# Altium schematic sheet [04] - uCONTROLLER AND GSM DIAGRAM.SchDoc
size A3; DocumentNumber: 2; SheetNumber: 2; SheetTotal: 4; .Checked PCB: .; .Checked SCH: .
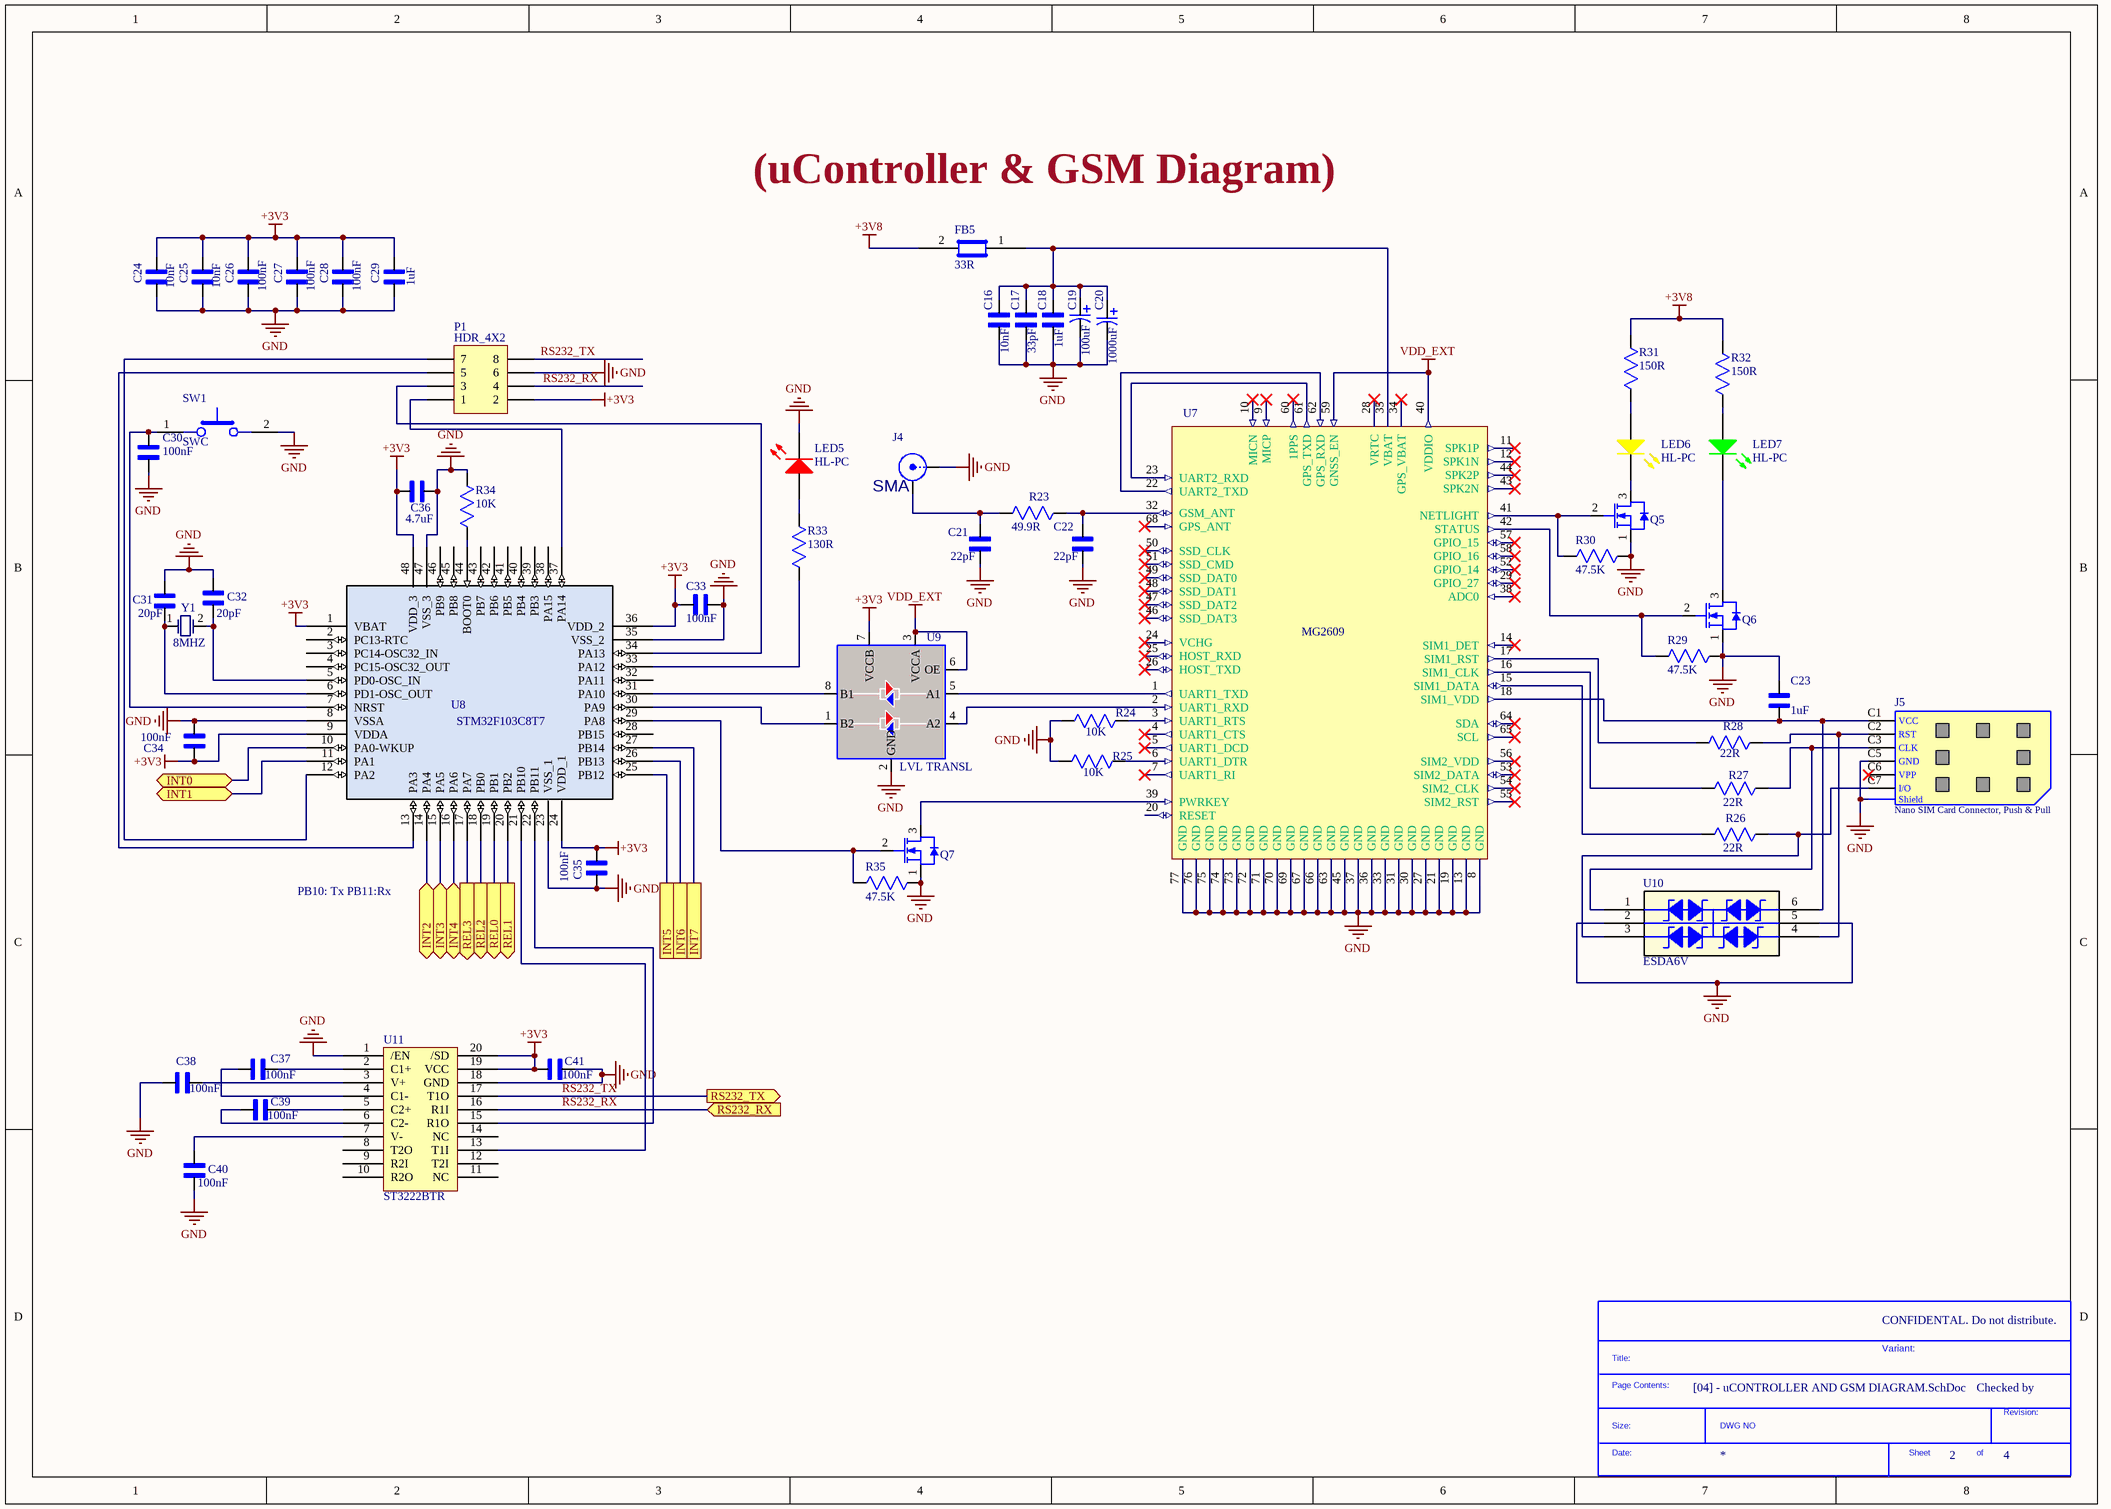
[diagram p0: [04] - uCONTROLLER AND GSM DIAGRAM.SchDoc]

## Parts
*  SDTitleBlock  (value not drawn)  (graphical)
C16  10nF  [CAP_0805]
C17  33pF  [CAP_0805]
C18  1uF  [CAP_0805]
C19  100uF  [CAP_TANT_CASEB]
C20  1000uF  [CAP_AL_0810]
C21  22pF  [CAP_0805]
C22  22pF  [CAP_0805]
C23  1uF  [CAP_0805]
C24  10nF  [CAP_0805]
C25  10nF  [CAP_0805]
C26  100nF  [CAP_0805]
C27  100nF  [CAP_0805]
C28  100nF  [CAP_0805]
C29  1uF  [CAP_0805]
C30  100nF  [CAP_0805]
C31  20pF  [CAP_0805]
C32  20pF  [CAP_0805]
C33  100nF  [CAP_0805]
C34  100nF  [CAP_0805]
C35  100nF  [CAP_0805]
C36  4.7uF  [CAP_0805]
C37  100nF  [CAP_0805]
C38  100nF  [CAP_0805]
C39  100nF  [CAP_0805]
C40  100nF  [CAP_0805]
C41  100nF  [CAP_0805]
FB5  33R  [FB_0603]
J4  SMA  [CONN_SMA_H]
J5  Nano SIM Card Connector, Push & Pull  [SOC_NSIM]
LED5  HL-PC  [LED_RED_1206]
LED6  HL-PC  [LED_YELLOW_1206]
LED7  HL-PC  [LED_GREEN_1206]
P1  HDR_4X2  [HDR2X4]
Q5  UTM2054G  [SOT-23]  (value not drawn)
Q6  UTM2054G  [SOT-23]  (value not drawn)
Q7  UTM2054G  [SOT-23]  (value not drawn)
R23  49.9R  [RES_0603]
R24  10K  [RES_0805]
R25  10K  [RES_0805]
R26  22R  [RES_0805]
R27  22R  [RES_0805]
R28  22R  [RES_0805]
R29  47.5K  [RES_0805]
R30  47.5K  [RES_0805]
R31  150R  [RES_0805]
R32  150R  [RES_0805]
R33  130R  [RES_0805]
R34  10K  [RES_0805]
R35  47.5K  [RES_0805]
SW1  SWC  [TAC_0603_VT]
U7  MG2609  [LCC_17P6X15P7X2P3]
U8  STM32F103C8T7  [LQFP-48]
U9  LVL TRANSL  [VSSOP8]
U10  ESDA6V  [SOT23-6L]
U11  ST3222BTR  [TSSOP20]
Y1  8MHZ  [CRYS_THT]

## Ports
INT0 (bidir), INT1 (bidir), INT2 (bidir), INT3 (bidir), INT4 (bidir), INT5, INT6, INT7, REL0 (out), REL1 (out), REL2 (out), REL3 (out), RS232_RX (in), RS232_TX (out)

## Nets
+3V3: C24.2 C25.2 C26.2 C27.2 C28.2 C29.2 C33.1 C34.2 C35.1 C36.1 C41.1 P1.2 U8.1(VBAT) U8.9(VDDA) U8.24(VDD_1) U8.36(VDD_2) U8.48(VDD_3) U9.7(VCCB) U11.19(VCC) U11.20(/SD)
+3V8: FB5.2 R31.1 R32.1
GND: C16.1 C17.1 C18.1 C19.2 C20.2 C21.1 C22.1 C23.2 C24.1 C25.1 C26.1 C27.1 C28.1 C29.1 C30.2 C31.2 C32.2 C33.2 C34.1 C35.2 C36.2 C38.1 C40.1 C41.2 J4.2 J5.C5(GND) J5.Shield LED5.1(K) P1.6 Q5.1(S) Q6.1(S) Q7.1(S) R24.2 R25.2 R29.1 R30.1 R34.1 R35.1 SW1.2 U7.8(GND) U7.13(GND) U7.19(GND) U7.21(GND) U7.27(GND) U7.30(GND) U7.31(GND) U7.33(GND) U7.36(GND) U7.37(GND) U7.45(GND) U7.63(GND) U7.66(GND) U7.67(GND) U7.69(GND) U7.70(GND) U7.71(GND) U7.72(GND) U7.73(GND) U7.74(GND) U7.75(GND) U7.76(GND) U7.77(GND) U8.8(VSSA) U8.23(VSS_1) U8.35(VSS_2) U8.47(VSS_3) U9.2(GND) U10.2 U10.5 U11.1(/EN) U11.18(GND)
VDD_EXT: U7.40(VDDIO) U7.59(GNSS_EN) U9.3(VCCA) U9.6(OE)
INT0: U8.10(PA0-WKUP) ; port INT0
INT1: U8.11(PA1) ; port INT1
INT2: U8.14(PA4) ; port INT2
INT3: U8.15(PA5) ; port INT3
INT4: U8.16(PA6) ; port INT4
INT5: U8.25(PB12) ; port INT5
INT6: U8.26(PB13) ; port INT6
INT7: U8.27(PB14) ; port INT7
REL0: U8.19(PB1) ; port REL0
REL1: U8.20(PB2) ; port REL1
REL2: U8.18(PB0) ; port REL2
REL3: U8.17(PA7) ; port REL3
RS232_RX: P1.4 U11.16(R1I) ; port RS232_RX
RS232_TX: P1.8 U11.17(T1O) ; port RS232_TX
NetC16_2: C16.2 C17.2 C18.2 C19.1 C20.1 FB5.1 U7.35(VBAT)
NetC21_2: C21.2 J4.1 R23.2
NetC22_2: C22.2 R23.1 U7.32(GSM_ANT)
NetC23_1: C23.1 J5.C1(VCC) U7.18(SIM1_VDD) U10.6
NetC30_1: C30.1 SW1.1 U8.7(NRST)
NetC31_1: C31.1 U8.6(PD1-OSC_OUT) Y1.1
NetC32_1: C32.1 U8.5(PD0-OSC_IN) Y1.2
NetC37_1: C37.1 U11.4(C1-)
NetC37_2: C37.2 U11.2(C1+)
NetC38_2: C38.2 U11.3(V+)
NetC39_1: C39.1 U11.6(C2-)
NetC39_2: C39.2 U11.5(C2+)
NetC40_2: C40.2 U11.7(V-)
NetJ5_C2: J5.C2(RST) R28.1 U10.4
NetJ5_C3: J5.C3(CLK) R27.1 U10.1
NetJ5_C7: J5.C7(I/O) R26.1 U10.3
NetLED5_2: LED5.2(A) R33.1
NetLED6_1: LED6.1(K) Q5.3(D)
NetLED6_2: LED6.2(A) R31.2
NetLED7_1: LED7.1(K) Q6.3(D)
NetLED7_2: LED7.2(A) R32.2
NetP1_1: P1.1 U8.37(PA14)
NetP1_3: P1.3 U8.34(PA13)
NetP1_5: P1.5 U8.13(PA3)
NetP1_7: P1.7 U8.12(PA2)
NetQ5_2: Q5.2(G) R30.2 U7.41(NETLIGHT)
NetQ6_2: Q6.2(G) R29.2 U7.42(STATUS)
NetQ7_2: Q7.2(G) R35.2 U8.29(PA8)
NetQ7_3: Q7.3(D) U7.39(PWRKEY)
NetR24_1: R24.1 U7.3(UART1_RTS)
NetR25_1: R25.1 U7.6(UART1_DTR)
NetR26_2: R26.2 U7.15(SIM1_DATA)
NetR27_2: R27.2 U7.16(SIM1_CLK)
NetR28_2: R28.2 U7.17(SIM1_RST)
NetR33_2: R33.2 U8.33(PA12)
NetR34_2: R34.2 U8.44(BOOT0)
NetU7_1: U7.1(UART1_TXD) U9.5(A1)
NetU7_2: U7.2(UART1_RXD) U9.4(A2)
NetU7_22: U7.22(UART2_TXD) U7.62(GPS_RXD)
NetU7_23: U7.23(UART2_RXD) U7.61(GPS_TXD)
NetU8_21: U8.21(PB10) U11.13(T1I)
NetU8_22: U8.22(PB11) U11.15(R1O)
NetU8_30: U8.30(PA9) U9.1(B2)
NetU8_31: U8.31(PA10) U9.8(B1)

Not connected (* = marked no-connect by the designer): J5 C6(VPP)*; U7 4(UART1_CTS)* 5(UART1_DCD)* 7(UART1_RI)* 9(MICP)* 10(MICN)* 11(SPK1P)* 12(SPK1N)* 14(SIM1_DET)* 20(RESET) 24(VCHG)* 25(HOST_RXD)* 26(HOST_TXD)* 28(VRTC)* 29(GPIO_27)* 34(GPS_VBAT)* 38(ADC0)* 43(SPK2N)* 44(SPK2P)* 46(SSD_DAT3)* 47(SSD_DAT2)* 48(SSD_DAT1)* 49(SSD_DAT0)* 50(SSD_CLK)* 51(SSD_CMD)* 52(GPIO_14)* 53(SIM2_DATA)* 54(SIM2_CLK)* 55(SIM2_RST)* 56(SIM2_VDD)* 57(GPIO_15)* 58(GPIO_16)* 60(1PPS)* 64(SDA)* 65(SCL)* 68(GPS_ANT)*; U8 2(PC13-RTC) 3(PC14-OSC32_IN) 4(PC15-OSC32_OUT) 28(PB15) 32(PA11) 38(PA15) 39(PB3) 40(PB4) 41(PB5) 42(PB6) 43(PB7) 45(PB8) 46(PB9); U11 8(T2O) 9(R2I) 10(R2O) 11(NC) 12(T2I) 14(NC)

## Notes on the sheet
- (uController & GSM Diagram)
- PB10: Tx PB11:Rx
- CONFIDENTAL. Do not distribute.
- Variant:
- Checked by
- (in symbol SDTitleBlock) Title:; Page Contents:; Revision:; Size:; DWG NO; Date:; Sheet; of

## Library data of the parts
C16 C24 C25 = CAP_0805: Product Name: CL21C103JBFNNNE; Product Description: MLCC (2012) 0805 10nF 50VDC ±5% C0G (NP0); .Checked PCB: CHK; Package: 0805; Value: 10nF; .Checked SCH: CHK
C17 = CAP_0805: Product Name: CL21C330GBANNNC; Product Description: MLCC (2012) 0805 33pF 50VDC ±2% C0G (NP0); .Checked PCB: CHK; Package: 0805; Value: 33pF; .Checked SCH: CHK
C18 C23 C29 = CAP_0805: Product Name: CL21F105ZBFNNNE; Product Description: MLCC (2012) 0805 1uF 50VDC -20% +80% Y5V; .Checked PCB: CHK; Package: 0805; Value: 1uF; .Checked SCH: CHK
C19 = CAP_TANT_CASEB: =Product Descriptipn; Product Name: T491B107K006AT; Product Description: CAP.TANTAL 100uF 6.3V 10% B CASE (3528) SMD KEMET; .Checked PCB: CHK; Value: 100uF; Case Dimension (mm) LxWxH: B CASE; .Checked SCH: CHK
C20 = CAP_AL_0810: =Product Description; Manufacturer: SAMYOUNG; Product Name: BXJ6.3VC1000MH10TP; Product Description: CAP.EL.1000uF 6V3 8x10 105C 5000Hrs SMD; .Checked PCB: CHK; Value: 1000uF; .Checked SCH: CHK
C21 C22 = CAP_0805: Product Name: CL21C220JBANNNC; Product Description: MLCC (2012) 0805 22pF 50VDC ±5% C0G (NP0); .Checked PCB: CHK; Package: 0805; Value: 22pF; .Checked SCH: CHK
C26-C28 C30 C33-C35 C37-C41 = CAP_0805: Product Name: CL21B104JBCNNNC; Product Description: MLCC (2012) 0805 100nF 50VDC ±5% X7R; .Checked PCB: CHK; Package: 0805; Value: 100nF; .Checked SCH: CHK
C31 C32 = CAP_0805: Product Name: CL21C200JBANNNC; Product Description: MLCC (2012) 0805 20pF 50VDC ±5% C0G (NP0); .Checked PCB: CHK; Package: 0805; Value: 20pF; .Checked SCH: CHK
C36 = CAP_0805: MLCC (2012) 0805 4.7uF 25VDC ±10% X5R; Product Name: CL21A475KAQNNNE; .Checked PCB: CHK; Package: 0805; Product Description: MLCC (2012) 0805 4.7uF 25VDC ±10% X5R; Value: 4.7uF; .Checked SCH: CHK
FB5 = FB_0603: =Product Description; Manufacturer: MURATA; Product Name: BLM18PG330SN1D; Product Description: FERRITE BEAD 0603 33R 3A MURATA; .Checked PCB: CHK; Value: 33R; Package / Case: 0603; .Checked SCH: CHK
J4 = SMA_RA: =Product Description; Product Name: L-KLS1-SMA045; Product Description: CONNECTOR SMA 5PIN THT R/A 8x8x14.8MM; .Checked PCB: CHK; Mounting Type: THT R/A; .Checked SCH: CHK; Value: SMA
J5 = SOC_NSIM: =Product Description; Manufacturer: ATTEND; Product Name: 115U-A000; Product Description: CONNECTOR NANO SIM CARD PUSH PULL 6PIN H:1.2MM; Number of Position: 6; Eject Mechanism: PUSH-PULL; .Checked PCB: CHK; .Checked SCH: CHK
LED5 = LED_RED_1206: =Product Description; Manufacturer: HONGLITRONIC; Product Description: LED SMD 1206 RED WATER CLEAR 90-120 mcd 140C; Product Name: HL-PC-3216S9AC; Color: RED; .Checked PCB: CHK; Value: HL-PC; .Checked SCH: CHK
LED6 = LED_YELLOW_1206: =Product Description; Manufacturer: HONGLITRONIC; Product Description: LED SMD 1206 YELLOW WATER CLEAR 90-120mcd 140C; Product Name: HL-PC-3216S29YC; Color: YELLOW; .Checked PCB: CHK; Value: HL-PC; .Checked SCH: CHK
LED7 = LED_GREEN_1206: =Product Description; Manufacturer: HONGLITRONIC; Product Description: LED SMD 1206 GREEN WATER CLEAR 600-800mcd; Product Name: HL-PC-3216U51GC; Color: GREEN; .Checked PCB: CHK; Value: HL-PC; .Checked SCH: CHK
P1 = HDR_4X2: =Product Description; Product Description: Header, 4-Pin, Dual row; .Checked PCB: CHK; LatestRevisionDate: 17-Jul-2002; LatestRevisionNote: Re-released for DXP Platform.; Publisher: Altium Limited; .Checked SCH: CHK
Q5-Q7 = MOSFET_N_SOT23: =Product Description; Manufacturer: UTC; Product Name: UTM2054G-AE3-R; Product Description: MOSFET DIS.5A 20V N-CH SOT23 ENHANCEMENT SMT; .Checked PCB: CHK; Package / Case: SOT23; Value: UTM2054G; .Checked SCH: CHK
R23 = RES_0603: =Product Description; Product Name: TC0325D499JT5C; Product Description: RES.(1608) 0603 49.9 Ohms 0.5% 1/16W 25PPM; Tolerance: ±0.5%; Watt: 1/16W; .Checked PCB: CHK; Package / Case: 0603; Value: 49.9R; .Checked SCH: CHK
R24 R25 R34 = RES_0805: =Product Description; Product Name: 0805S8J0103T5E; Package2: 0805; Product Description: RES.(2012) 0805 10K Ohms 5% 1/8W-S 100PPM; .Checked PCB: CHK; Value: 10K; .Checked SCH: CHK
R26-R28 = RES_0805: =Product Description; Product Name: CQ05S8F220JT5E; Package2: 0805; Product Description: RES.(2012) 0805 22 Ohms 1% 1/8W-S AUTOMOTIV; .Checked PCB: CHK; Value: 22R; .Checked SCH: CHK
R29 R30 R35 = RES_0805: =Product Description; Product Name: 0805S8F4752T5E; Package2: 0805; Product Description: RES.(2012) 0805 47.5K Ohms 1% 1/8W-S 100PPM; .Checked PCB: CHK; Value: 47.5K; .Checked SCH: CHK
R31 R32 = RES_0805: =Product Description; Product Name: 0805S8J0151T5E; Package2: 0805; Product Description: RES.(2012) 0805 150 Ohms 5% 1/8W-S 100PPM; .Checked PCB: CHK; Value: 150R; .Checked SCH: CHK
R33 = RES_0805: =Product Description; Product Name: 0805S8J0131T5E; Package2: 0805; Product Description: RES.(2012) 0805 130 Ohms 5% 1/8W-S 100PPM; .Checked PCB: CHK; Value: 130R; .Checked SCH: CHK
SW1 = TACT_SMD_VT_6MM: =Product Description; .Checked PCB: CHK; Product Name: DTSMF-31R-V-T/R; Product Description: SWITCH TACT 6x3.5MM 4.3MM 260gf SMD DIPTRONICS; .Checked SCH: CHK; Outline: SWC; Value: SWC
U7 = MG2609: Product Description; Manufacturer: GOSUNCN; Product Name: HZ-MG2609-C1B-MK-01; Product Description: MODULE GSM/GPRS + ( OPTIONAL )GNSS; .Checked PCB: CHK; Package / Case: LCC (17.6 x 15.7 x 2.3); Value: MG2609; .Checked SCH: CHK
U8 = STM32F103C8T7: IC-32F103C MCU 32BIT 64KB FLASH 48LQFP; Product Name: STM32F103C8T7TR; .Checked PCB: CHK; Link: https://www.ozdisan.com/integrated-circuits-ics/embedded-ics/microcontrollers/STM32F103C8T7TR; .Checked SCH: CHK
U9 = TXB0102DCUR: =Product Description; Manufacturer: TEXAS; Product Description: IC-102 VOLT-LVL TRANSL BI-DIR US8; .Checked SCH: CHK; Value: LVL TRANSL; Product Name: TXB0102DCUR; Package / Case: VSSOP8; .Checked PCB: CHK
U10 = TVS_SOT236: =Product Description; Manufacturer: STM; Product Name: ESDA6V1BC6; Product Description: DIODE TVS 80W 5V SOT23 SMD; .Checked PCB: CHK; Package / Case: SOT23-6; .Checked SCH: CHK
U11 = TRANS_RS232: =Product Description; Product Description: IC-3222 DRIVER/RCVR RS232 LP 20-TSSOP; .Checked PCB: CHK; Product Name: ST3222BTR; Package: TSSOP20; Value: ST3222BTR; .Checked SCH: CHK
Y1 = CRYS-THT: =Product Description; Product Name: AS-8.000-20-H35; Product Description: CRYSTAL 8MHZ HC49S 20pF 30ppm SHORT BULK RALTRON; .Checked PCB: CHK; Value: 8MHZ; Package / Case: HC-49S; .Checked SCH: CHK